# Altium schematic sheet TOP-LEVEL.SchDoc
size A4; SheetNumber: 1; SheetTotal: 7
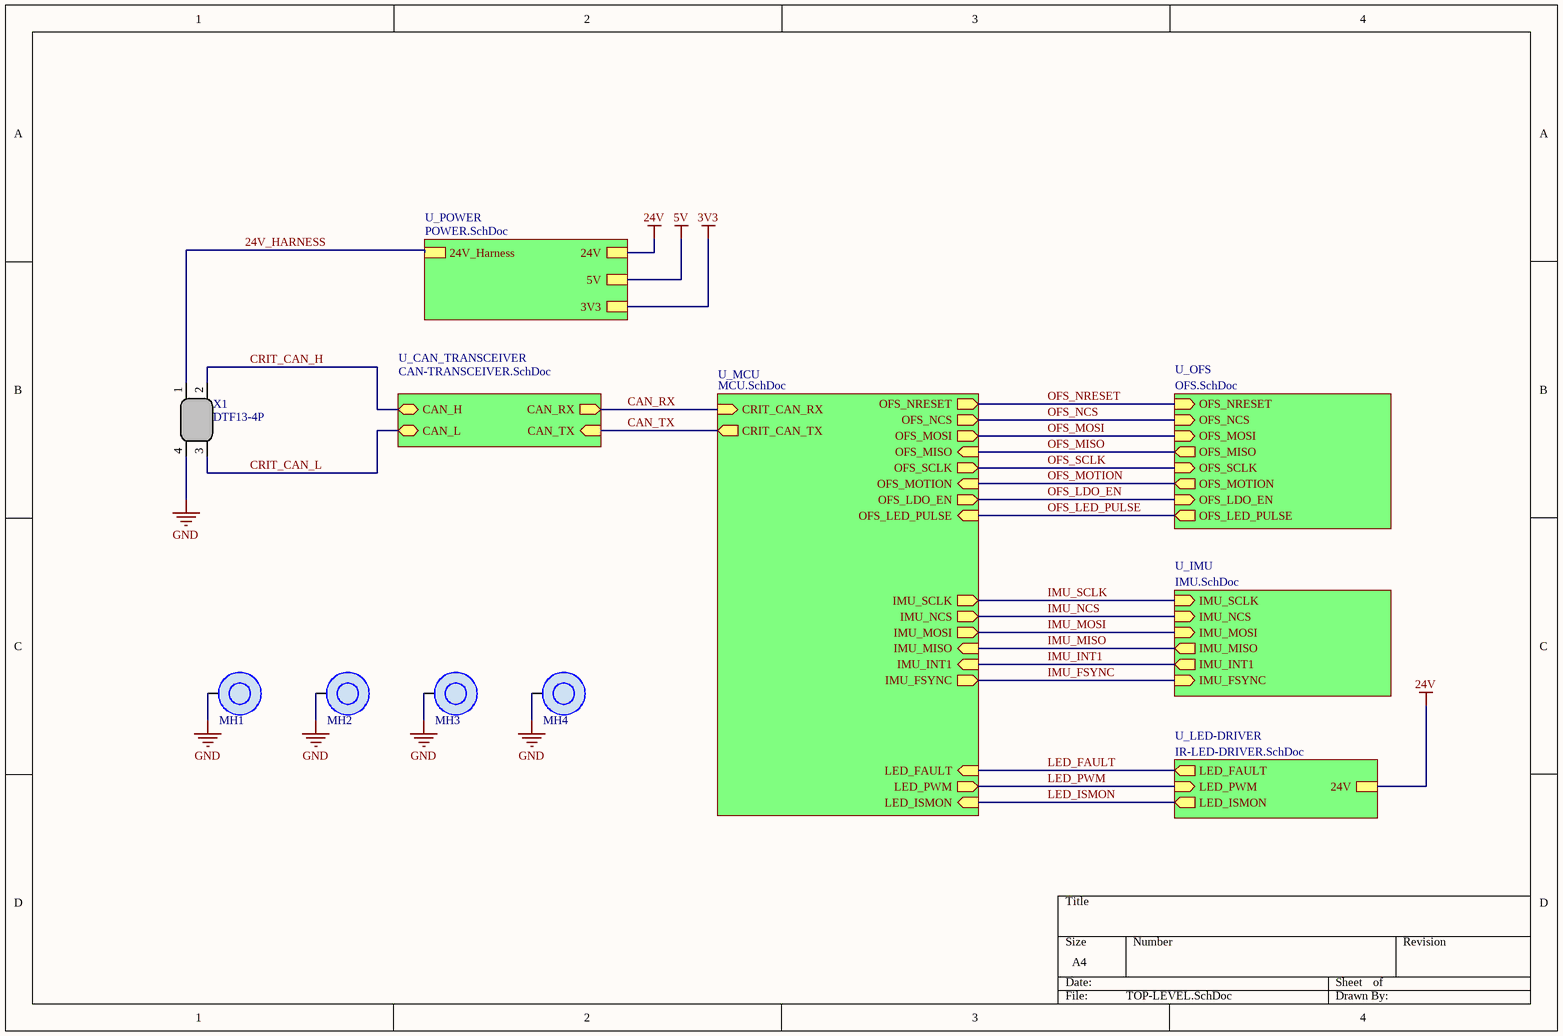
[diagram p0: TOP-LEVEL.SchDoc]

## Parts
MH1  MOUNTING_HOLE  [MOUNTING_HOLE]  (value not drawn)
MH2  MOUNTING_HOLE  [MOUNTING_HOLE]  (value not drawn)
MH3  MOUNTING_HOLE  [MOUNTING_HOLE]  (value not drawn)
MH4  MOUNTING_HOLE  [MOUNTING_HOLE]  (value not drawn)
X1  DTF13-4P  [DTF13-4P]

## Sub-sheets
U_CAN_TRANSCEIVER = CAN-TRANSCEIVER.SchDoc: CAN_L (bidir), CAN_H (bidir), CAN_TX (in), CAN_RX (out)
U_IMU = IMU.SchDoc: IMU_SCLK (in), IMU_NCS (in), IMU_MOSI (in), IMU_MISO (out), IMU_INT1 (out), IMU_FSYNC (in)
U_LED-DRIVER = IR-LED-DRIVER.SchDoc: LED_ISMON (out), LED_FAULT (out), LED_PWM (in), 24V
U_MCU = MCU.SchDoc: CRIT_CAN_RX (in), CRIT_CAN_TX (out), OFS_NRESET (out), OFS_NCS (out), OFS_LDO_EN (out), OFS_MOTION (in), OFS_SCLK (out), OFS_MISO (in), OFS_MOSI (out), OFS_LED_PULSE (in), LED_ISMON (in), LED_PWM (out), LED_FAULT (in), IMU_FSYNC (out), IMU_INT1 (in), IMU_MISO (in), IMU_MOSI (out), IMU_NCS (out), IMU_SCLK (out)
U_OFS = OFS.SchDoc: OFS_NRESET (in), OFS_MOSI (in), OFS_SCLK (in), OFS_MOTION (out), OFS_LDO_EN (in), OFS_NCS (in), OFS_MISO (out), OFS_LED_PULSE (out)
U_POWER = POWER.SchDoc: 24V, 24V_Harness, 5V, 3V3

## Nets
3V3: sheet U_POWER/3V3
5V: sheet U_POWER/5V
24V: sheet U_POWER/24V, sheet U_LED-DRIVER/24V
GND: MH1.1 MH2.1 MH3.1 MH4.1 X1.4
24V_HARNESS: X1.1 ; sheet U_POWER/24V_Harness
CAN_RX: sheet U_CAN_TRANSCEIVER/CAN_RX, sheet U_MCU/CRIT_CAN_RX
CAN_TX: sheet U_CAN_TRANSCEIVER/CAN_TX, sheet U_MCU/CRIT_CAN_TX
CRIT_CAN_H: X1.2 ; sheet U_CAN_TRANSCEIVER/CAN_H
CRIT_CAN_L: X1.3 ; sheet U_CAN_TRANSCEIVER/CAN_L
IMU_FSYNC: sheet U_MCU/IMU_FSYNC, sheet U_IMU/IMU_FSYNC
IMU_INT1: sheet U_MCU/IMU_INT1, sheet U_IMU/IMU_INT1
IMU_MISO: sheet U_MCU/IMU_MISO, sheet U_IMU/IMU_MISO
IMU_MOSI: sheet U_MCU/IMU_MOSI, sheet U_IMU/IMU_MOSI
IMU_NCS: sheet U_MCU/IMU_NCS, sheet U_IMU/IMU_NCS
IMU_SCLK: sheet U_MCU/IMU_SCLK, sheet U_IMU/IMU_SCLK
LED_FAULT: sheet U_MCU/LED_FAULT, sheet U_LED-DRIVER/LED_FAULT
LED_ISMON: sheet U_MCU/LED_ISMON, sheet U_LED-DRIVER/LED_ISMON
LED_PWM: sheet U_MCU/LED_PWM, sheet U_LED-DRIVER/LED_PWM
OFS_LDO_EN: sheet U_MCU/OFS_LDO_EN, sheet U_OFS/OFS_LDO_EN
OFS_LED_PULSE: sheet U_MCU/OFS_LED_PULSE, sheet U_OFS/OFS_LED_PULSE
OFS_MISO: sheet U_MCU/OFS_MISO, sheet U_OFS/OFS_MISO
OFS_MOSI: sheet U_MCU/OFS_MOSI, sheet U_OFS/OFS_MOSI
OFS_MOTION: sheet U_MCU/OFS_MOTION, sheet U_OFS/OFS_MOTION
OFS_NCS: sheet U_MCU/OFS_NCS, sheet U_OFS/OFS_NCS
OFS_NRESET: sheet U_MCU/OFS_NRESET, sheet U_OFS/OFS_NRESET
OFS_SCLK: sheet U_MCU/OFS_SCLK, sheet U_OFS/OFS_SCLK

## Library data of the parts
X1 = TE_DTF13-4P: Connector Header Through Hole, Right Angle 4 position 0.175" (4.44mm); ComponentLink1Description: Datasheet; ComponentLink1URL: https://www.te.com/usa-en/product-DTF13-4P.html; ComponentLink2Description: Digikey; ComponentLink2URL: https://www.digikey.com/en/products/detail/te-connectivity-deutsch-connectors/DTF13-4P/7220163